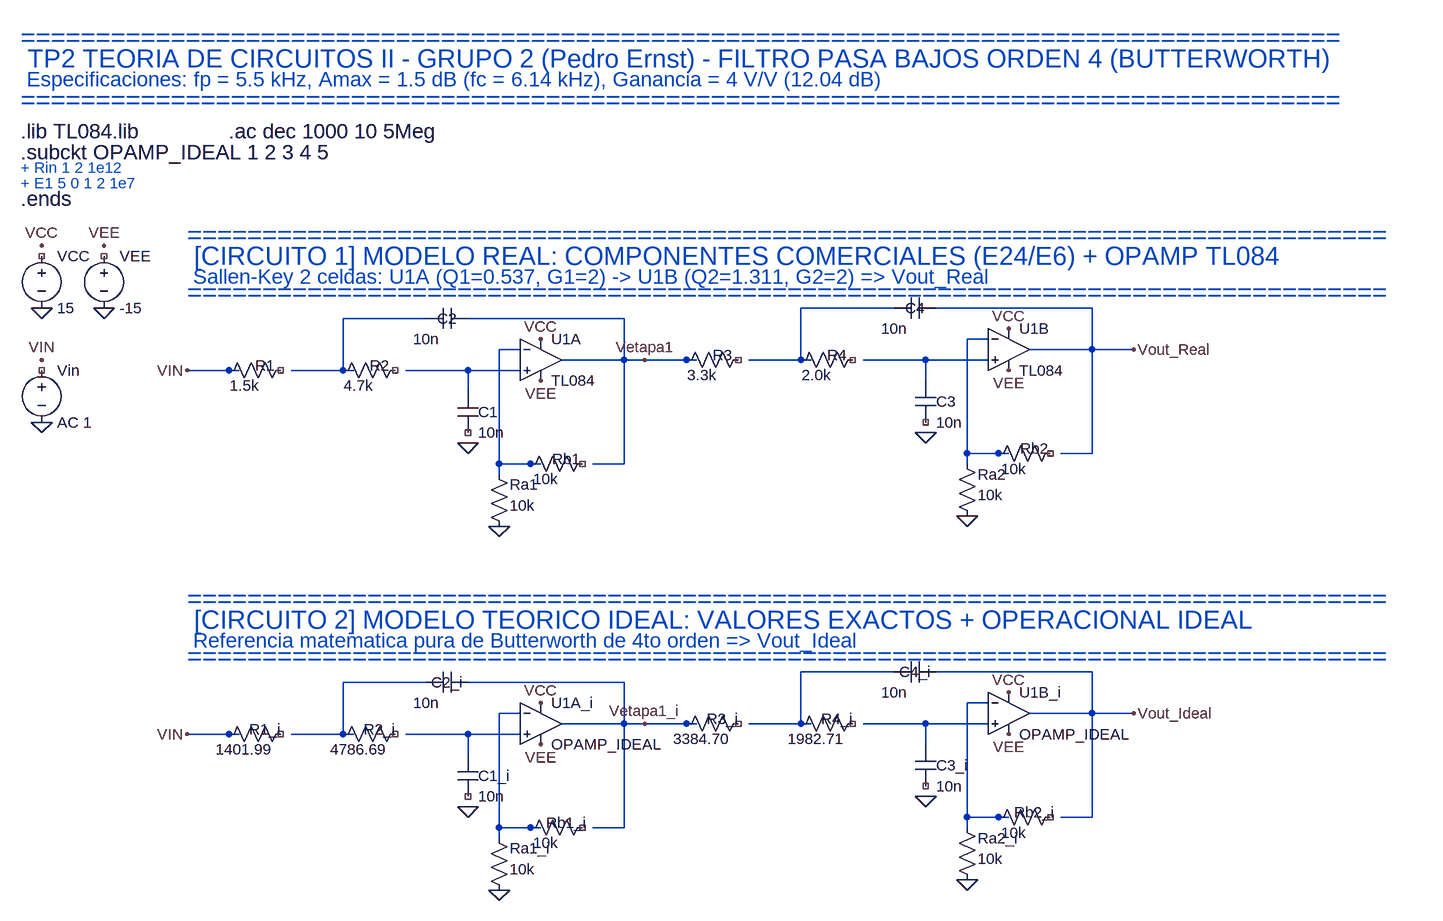
[diagram p0: schematic Filtro_PasaBajos_Orden4_Grupo2.asc]
Filtro_PasaBajos_Orden4_Grupo2.asc, the LTspice schematic file:
Version 4
SHEET 1 2400 1400
TEXT 64 32 Left 4 ;========================================================================================
TEXT 64 64 Left 4 ; TP2 TEORIA DE CIRCUITOS II - GRUPO 2 (Pedro Ernst) - FILTRO PASA BAJOS ORDEN 4 (BUTTERWORTH)
TEXT 64 96 Left 3 ; Especificaciones: fp = 5.5 kHz, Amax = 1.5 dB (fc = 6.14 kHz), Ganancia = 4 V/V (12.04 dB)
TEXT 64 128 Left 4 ;========================================================================================
TEXT 64 176 Left 3 !.lib TL084.lib
TEXT 64 208 Left 3 !.subckt OPAMP_IDEAL 1 2 3 4 5
TEXT 64 232 Left 2 + Rin 1 2 1e12
TEXT 64 256 Left 2 + E1 5 0 1 2 1e7
TEXT 64 280 Left 3 !.ends
TEXT 384 176 Left 3 !.ac dec 1000 10 5Meg

SYMBOL voltage 96 352 R0
WINDOW 123 0 0 Left 2
WINDOW 39 0 0 Left 2
SYMATTR InstName VCC
SYMATTR Value 15
FLAG 96 352 VCC
FLAG 96 448 0

SYMBOL voltage 192 352 R0
WINDOW 123 0 0 Left 2
WINDOW 39 0 0 Left 2
SYMATTR InstName VEE
SYMATTR Value -15
FLAG 192 352 VEE
FLAG 192 448 0

SYMBOL voltage 96 528 R0
WINDOW 123 0 0 Left 2
WINDOW 39 0 0 Left 2
SYMATTR InstName Vin
SYMATTR Value AC 1
FLAG 96 528 VIN
FLAG 96 624 0

TEXT 320 336 Left 4 ;================================================================================
TEXT 320 368 Left 4 ; [CIRCUITO 1] MODELO REAL: COMPONENTES COMERCIALES (E24/E6) + OPAMP TL084
TEXT 320 400 Left 3 ; Sallen-Key 2 celdas: U1A (Q1=0.537, G1=2) -> U1B (Q2=1.311, G2=2) => Vout_Real
TEXT 320 424 Left 4 ;================================================================================

FLAG 320 544 VIN
WIRE 320 544 384 544

SYMBOL res 480 528 R90
WINDOW 0 24 40 VBottom 2
WINDOW 3 24 72 VTop 2
SYMATTR InstName R1
SYMATTR Value 1.5k
WIRE 384 544 400 544
WIRE 480 544 560 544

SYMBOL res 656 528 R90
WINDOW 0 24 40 VBottom 2
WINDOW 3 24 72 VTop 2
SYMATTR InstName R2
SYMATTR Value 4.7k
WIRE 560 544 576 544
WIRE 656 544 752 544

SYMBOL cap 736 576 R0
WINDOW 0 32 32 Left 2
WINDOW 3 32 64 Left 2
SYMATTR InstName C1
SYMATTR Value 10n
WIRE 752 544 752 576
FLAG 752 656 0

WIRE 560 544 560 464
SYMBOL cap 752 448 R90
WINDOW 0 32 32 VBottom 2
WINDOW 3 32 64 VTop 2
SYMATTR InstName C2
SYMATTR Value 10n
WIRE 560 464 688 464
WIRE 752 464 992 464
WIRE 992 464 992 528

SYMBOL OpAmps\\opamp2 864 464 R0
SYMATTR InstName U1A
SYMATTR Value TL084
WIRE 752 544 832 544
FLAG 864 496 VCC
FLAG 864 560 VEE
WIRE 896 528 992 528
WIRE 992 528 1024 528
FLAG 1024 528 Vetapa1

WIRE 832 512 800 512
WIRE 800 512 800 688

SYMBOL res 784 688 R0
WINDOW 0 32 32 Left 2
WINDOW 3 32 64 Left 2
SYMATTR InstName Ra1
SYMATTR Value 10k
WIRE 800 688 800 704
FLAG 800 784 0

SYMBOL res 944 672 R90
WINDOW 0 24 40 VBottom 2
WINDOW 3 24 72 VTop 2
SYMATTR InstName Rb1
SYMATTR Value 10k
WIRE 800 688 864 688
WIRE 944 688 992 688
WIRE 992 528 992 688

WIRE 1024 528 1088 528

SYMBOL res 1184 512 R90
WINDOW 0 24 40 VBottom 2
WINDOW 3 24 72 VTop 2
SYMATTR InstName R3
SYMATTR Value 3.3k
WIRE 1088 528 1104 528
WIRE 1184 528 1264 528

SYMBOL res 1360 512 R90
WINDOW 0 24 40 VBottom 2
WINDOW 3 24 72 VTop 2
SYMATTR InstName R4
SYMATTR Value 2.0k
WIRE 1264 528 1280 528
WIRE 1360 528 1456 528

SYMBOL cap 1440 560 R0
WINDOW 0 32 32 Left 2
WINDOW 3 32 64 Left 2
SYMATTR InstName C3
SYMATTR Value 10n
WIRE 1456 528 1456 560
FLAG 1456 640 0

WIRE 1264 528 1264 448
SYMBOL cap 1472 432 R90
WINDOW 0 32 32 VBottom 2
WINDOW 3 32 64 VTop 2
SYMATTR InstName C4
SYMATTR Value 10n
WIRE 1264 448 1408 448
WIRE 1472 448 1712 448
WIRE 1712 448 1712 512

SYMBOL OpAmps\\opamp2 1584 448 R0
SYMATTR InstName U1B
SYMATTR Value TL084
WIRE 1456 528 1552 528
FLAG 1584 480 VCC
FLAG 1584 544 VEE
WIRE 1616 512 1712 512
WIRE 1712 512 1776 512
FLAG 1776 512 Vout_Real

WIRE 1552 496 1520 496
WIRE 1520 496 1520 672

SYMBOL res 1504 672 R0
WINDOW 0 32 32 Left 2
WINDOW 3 32 64 Left 2
SYMATTR InstName Ra2
SYMATTR Value 10k
WIRE 1520 672 1520 688
FLAG 1520 768 0

SYMBOL res 1664 656 R90
WINDOW 0 24 40 VBottom 2
WINDOW 3 24 72 VTop 2
SYMATTR InstName Rb2
SYMATTR Value 10k
WIRE 1520 672 1584 672
WIRE 1664 672 1712 672
WIRE 1712 512 1712 672

TEXT 320 896 Left 4 ;================================================================================
TEXT 320 928 Left 4 ; [CIRCUITO 2] MODELO TEORICO IDEAL: VALORES EXACTOS + OPERACIONAL IDEAL
TEXT 320 960 Left 3 ; Referencia matematica pura de Butterworth de 4to orden => Vout_Ideal
TEXT 320 984 Left 4 ;================================================================================

FLAG 320 1104 VIN
WIRE 320 1104 384 1104

SYMBOL res 480 1088 R90
WINDOW 0 24 40 VBottom 2
WINDOW 3 24 72 VTop 2
SYMATTR InstName R1_i
SYMATTR Value 1401.99
WIRE 384 1104 400 1104
WIRE 480 1104 560 1104

SYMBOL res 656 1088 R90
WINDOW 0 24 40 VBottom 2
WINDOW 3 24 72 VTop 2
SYMATTR InstName R2_i
SYMATTR Value 4786.69
WIRE 560 1104 576 1104
WIRE 656 1104 752 1104

SYMBOL cap 736 1136 R0
WINDOW 0 32 32 Left 2
WINDOW 3 32 64 Left 2
SYMATTR InstName C1_i
SYMATTR Value 10n
WIRE 752 1104 752 1136
FLAG 752 1216 0

WIRE 560 1104 560 1024
SYMBOL cap 752 1008 R90
WINDOW 0 32 32 VBottom 2
WINDOW 3 32 64 VTop 2
SYMATTR InstName C2_i
SYMATTR Value 10n
WIRE 560 1024 688 1024
WIRE 752 1024 992 1024
WIRE 992 1024 992 1088

SYMBOL OpAmps\\opamp2 864 1024 R0
SYMATTR InstName U1A_i
SYMATTR Value OPAMP_IDEAL
WIRE 752 1104 832 1104
FLAG 864 1056 VCC
FLAG 864 1120 VEE
WIRE 896 1088 992 1088
WIRE 992 1088 1024 1088
FLAG 1024 1088 Vetapa1_i

WIRE 832 1072 800 1072
WIRE 800 1072 800 1248

SYMBOL res 784 1248 R0
WINDOW 0 32 32 Left 2
WINDOW 3 32 64 Left 2
SYMATTR InstName Ra1_i
SYMATTR Value 10k
WIRE 800 1248 800 1264
FLAG 800 1344 0

SYMBOL res 944 1232 R90
WINDOW 0 24 40 VBottom 2
WINDOW 3 24 72 VTop 2
SYMATTR InstName Rb1_i
SYMATTR Value 10k
WIRE 800 1248 864 1248
WIRE 944 1248 992 1248
WIRE 992 1088 992 1248

WIRE 1024 1088 1088 1088

SYMBOL res 1184 1072 R90
WINDOW 0 24 40 VBottom 2
WINDOW 3 24 72 VTop 2
SYMATTR InstName R3_i
SYMATTR Value 3384.70
WIRE 1088 1088 1104 1088
WIRE 1184 1088 1264 1088

SYMBOL res 1360 1072 R90
WINDOW 0 24 40 VBottom 2
WINDOW 3 24 72 VTop 2
SYMATTR InstName R4_i
SYMATTR Value 1982.71
WIRE 1264 1088 1280 1088
WIRE 1360 1088 1456 1088

SYMBOL cap 1440 1120 R0
WINDOW 0 32 32 Left 2
WINDOW 3 32 64 Left 2
SYMATTR InstName C3_i
SYMATTR Value 10n
WIRE 1456 1088 1456 1120
FLAG 1456 1200 0

WIRE 1264 1088 1264 1008
SYMBOL cap 1472 992 R90
WINDOW 0 32 32 VBottom 2
WINDOW 3 32 64 VTop 2
SYMATTR InstName C4_i
SYMATTR Value 10n
WIRE 1264 1008 1408 1008
WIRE 1472 1008 1712 1008
WIRE 1712 1008 1712 1072

SYMBOL OpAmps\\opamp2 1584 1008 R0
SYMATTR InstName U1B_i
SYMATTR Value OPAMP_IDEAL
WIRE 1456 1088 1552 1088
FLAG 1584 1040 VCC
FLAG 1584 1104 VEE
WIRE 1616 1072 1712 1072
WIRE 1712 1072 1776 1072
FLAG 1776 1072 Vout_Ideal

WIRE 1552 1056 1520 1056
WIRE 1520 1056 1520 1232

SYMBOL res 1504 1232 R0
WINDOW 0 32 32 Left 2
WINDOW 3 32 64 Left 2
SYMATTR InstName Ra2_i
SYMATTR Value 10k
WIRE 1520 1232 1520 1248
FLAG 1520 1328 0

SYMBOL res 1664 1216 R90
WINDOW 0 24 40 VBottom 2
WINDOW 3 24 72 VTop 2
SYMATTR InstName Rb2_i
SYMATTR Value 10k
WIRE 1520 1232 1584 1232
WIRE 1664 1232 1712 1232
WIRE 1712 1072 1712 1232

The netlist it stands for:
* Filtro_PasaBajos_Orden4_Grupo2.asc
VCC NC_01 0 15
VEE NC_02 0 -15
Vin NC_03 0 AC 1
R1 NC_04 VIN 1.5k
R2 NC_05 N001 4.7k
C1 N002 NC_06 10n
C2 Vetapa1 N001 10n
XU1A N002 N003 VCC VEE Vetapa1 TL084  ; pins In+ In- V+ V- OUT
Ra1 N003 0 10k
Rb1 NC_07 N003 10k
R3 NC_08 Vetapa1 3.3k
R4 NC_09 N004 2.0k
C3 N005 NC_10 10n
C4 Vout_Real N004 10n
XU1B N005 N006 VCC VEE Vout_Real TL084  ; pins In+ In- V+ V- OUT
Ra2 N006 0 10k
Rb2 NC_11 N006 10k
R1_i NC_12 VIN 1401.99
R2_i NC_13 N007 4786.69
C1_i N008 NC_14 10n
C2_i Vetapa1_i N007 10n
XU1A_i N008 N009 VCC VEE Vetapa1_i OPAMP_IDEAL  ; pins In+ In- V+ V- OUT
Ra1_i N009 0 10k
Rb1_i NC_15 N009 10k
R3_i NC_16 Vetapa1_i 3384.70
R4_i NC_17 N010 1982.71
C3_i N011 NC_18 10n
C4_i Vout_Ideal N010 10n
XU1B_i N011 N012 VCC VEE Vout_Ideal OPAMP_IDEAL  ; pins In+ In- V+ V- OUT
Ra2_i N012 0 10k
Rb2_i NC_19 N012 10k
* ========================================================================================
*  TP2 TEORIA DE CIRCUITOS II - GRUPO 2 (Pedro Ernst) - FILTRO PASA BAJOS ORDEN 4 (BUTTERWORTH)
*  Especificaciones: fp = 5.5 kHz, Amax = 1.5 dB (fc = 6.14 kHz), Ganancia = 4 V/V (12.04 dB)
* ========================================================================================
.lib TL084.lib
.subckt OPAMP_IDEAL 1 2 3 4 5
* + Rin 1 2 1e12
* + E1 5 0 1 2 1e7
.ends
.ac dec 1000 10 5Meg
* ================================================================================
*  [CIRCUITO 1] MODELO REAL: COMPONENTES COMERCIALES (E24/E6) + OPAMP TL084
*  Sallen-Key 2 celdas: U1A (Q1=0.537, G1=2) -> U1B (Q2=1.311, G2=2) => Vout_Real
* ================================================================================
* ================================================================================
*  [CIRCUITO 2] MODELO TEORICO IDEAL: VALORES EXACTOS + OPERACIONAL IDEAL
*  Referencia matematica pura de Butterworth de 4to orden => Vout_Ideal
* ================================================================================
.backanno
.end